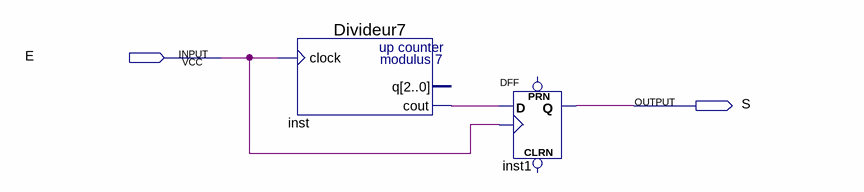
[diagram p0: schematic sheet]
// Quartus schematic Div7_corrige.bdf as structural Verilog: 2 symbols, 2 pins
module Div7_corrige (
  input  E,
  output S
);

  wire inst_cout;

  Divideur7 inst (.clock(E), .cout(inst_cout));  // open: q
  DFF inst1 (.CLK(E), .D(inst_cout), .Q(S));  // open: CLRN, PRN
endmodule
